# EasyEDA schematic schematic.json
TITLE: Sheet_1; REV: 1.0; Date: 2026-11-13; Sheet: 1/1; Company: Your Company
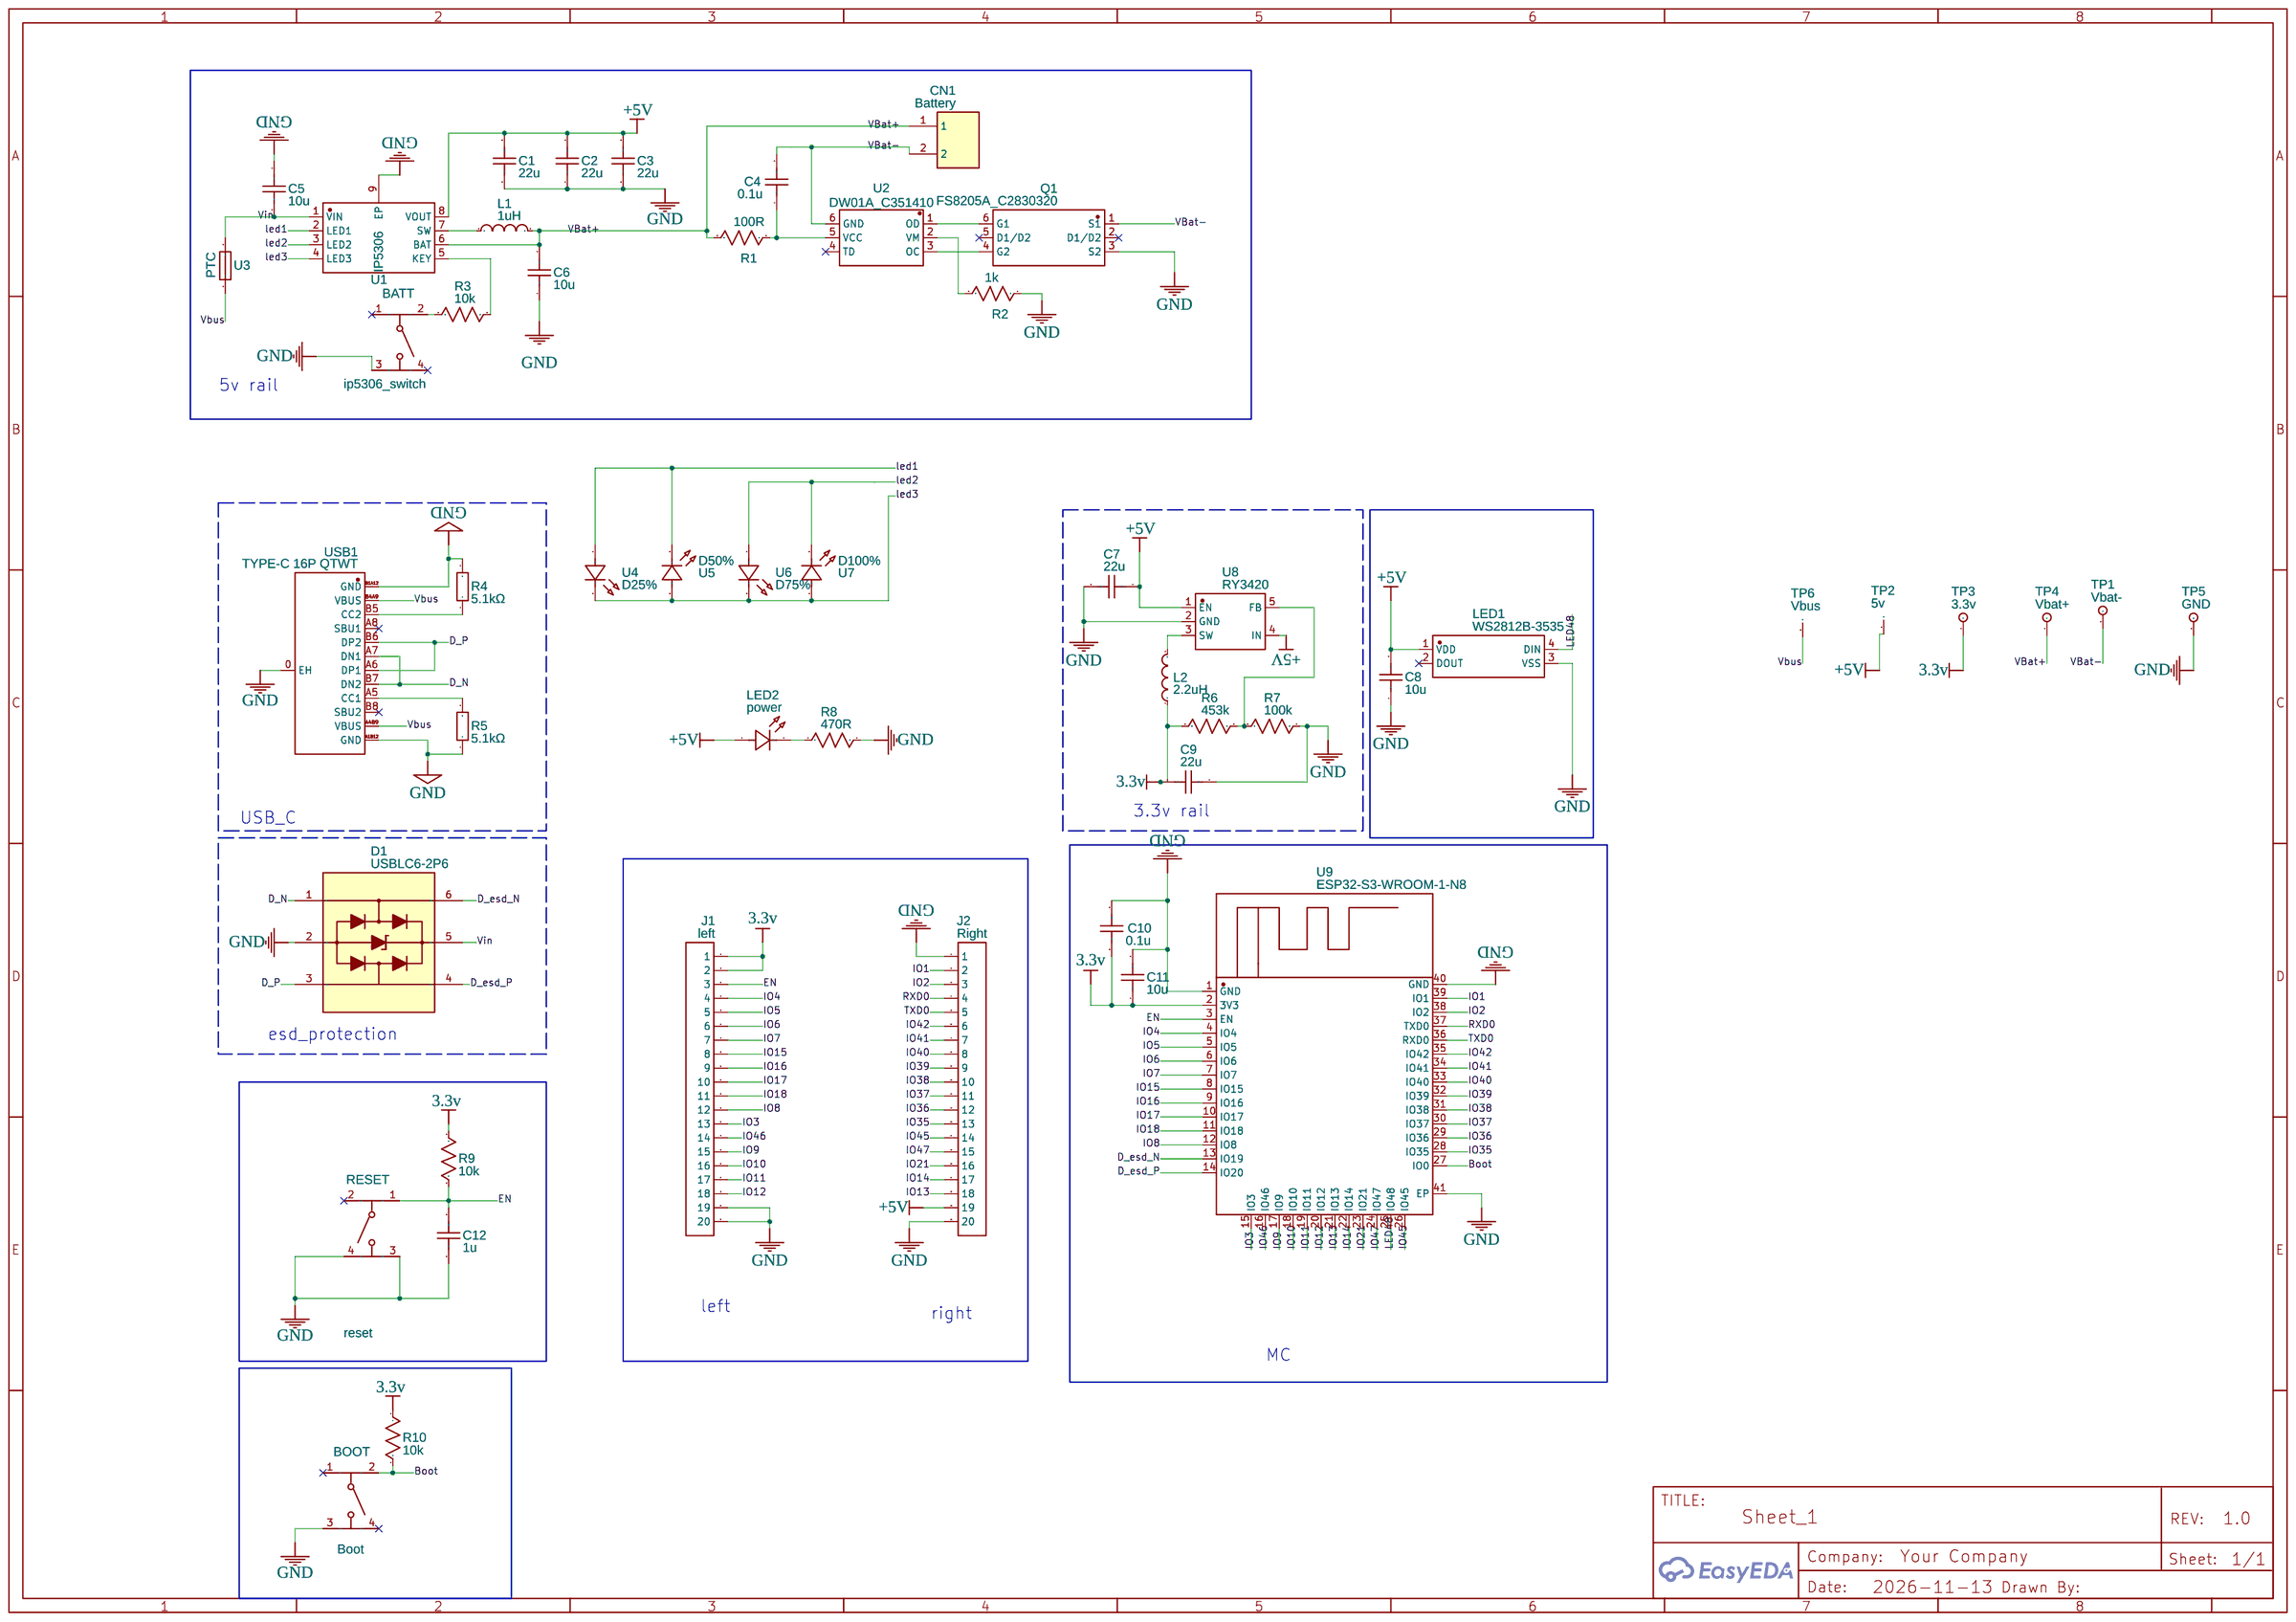
[diagram p0: schematic sheet]

## Parts
BATT  ip5306_switch  [SW-SMD_4P-L4.2-W3.4-P2.15-LS5.2]
BOOT  Boot  [SW-SMD_4P-L4.2-W3.4-P2.15-LS5.2]
C1  22u  [C0805]
C2  22u  [C0805]
C3  22u  [C0805]
C4  0.1u  [C0603]
C5  10u  [C0603]
C6  10u  [C0603]
C7  22u  [C0805]
C8  10u  [C0603]
C9  22u  [C0805]
C10  0.1u  [C0603]
C11  10u  [C0603]
C12  1u  [C0603]
CN1  Battery  [CONN-TH_B2B-PH-K-S]
D1  USBLC6-2P6  [SOT-666-6_L1.6-W1.2-P0.50-LS1.6-BR]
J1  left  [HDR-M-2.54_1X20]
J2  Right  [HDR-M-2.54_1X20]
L1  1uH  [IND-SMD_L4.0-W4.0]
L2  2.2uH  [IND-SMD_L4.0-W4.0_LQH44PN2R2MP0L]
LED1  WS2812B-3535  [LED-SMD_4P-L3.5-W3.5-TL_WS2812B]
LED2  power  [LED0603-FD]
Q1  FS8205A_C2830320  [SOT-23-6_L2.9-W1.6-P0.95-LS2.8-BR]
R1  100R  [R0603]
R2  1k  [R0603]
R3  10k  [R0603]
R4  5.1kΩ  [R0603]
R5  5.1kΩ  [R0603]
R6  453k  [R0603]
R7  100k  [R0603]
R8  470R  [R0603]
R9  10k  [R0603]
R10  10k  [R0603]
RESET  reset  [SW-SMD_4P-L4.2-W3.4-P2.15-LS5.2]
TP1  Vbat-  [TEST_POINT_W1]
TP2  5v  [TEST_POINT_W1]
TP3  3.3v  [TEST_POINT_W1]
TP4  Vbat+  [TEST_POINT_W1]
TP5  GND  [TEST_POINT_W1]
TP6  Vbus  [TEST_POINT_W1]
U1  IP5306  [ESOP-8_L4.9-W3.9-P1.27-LS6.0-BL-EP]
U2  DW01A_C351410  [SOT-23-6_L2.9-W1.6-P0.95-LS2.8-BL]
U3  PTC  [R1812]
U4  D25%  [LED0603-FD]
U5  D50%  [LED0603-FD]
U6  D75%  [LED0603-FD]
U7  D100%  [LED0603-FD]
U8  RY3420  [SOT-23-5_L2.9-W1.6-P0.95-LS2.8-BL]
U9  ESP32-S3-WROOM-1-N8  [WIFIM-SMD_ESP32-S3-WROOM-1-N8]
USB1  TYPE-C 16P QTWT  [USB-TYPE-C-SMD_TYPE-C-16P-QTWT]

## Library data of the parts
BATT BOOT RESET = 4.5x4.5x7.1 SMD Tactile Switch: Supplier: LCSC; Manufacturer: ReliaPro; Supplier Part: C28777; JLCPCB Part Class: Extended Part
C1-C12 = C_0603_US: Contributor: LCEDA_Lib
CN1 = B2B-PH-K-S(LF)(SN): Contributor: LCSC; Supplier: LCSC; Manufacturer: JST; Supplier Part: C131337; JLCPCB Part Class: Extended Part
D1 = USBLC6-2P6: Supplier: LCSC; Manufacturer: ST(意法半导体); Supplier Part: C15999; JLCPCB Part Class: Extended Part
J1 J2 = HDR-M-2.54_1x20: Supplier Part: C50981; Supplier: LCSC; Contributor: LCEDA_Lib
L1 = CMLW4030S1R0NST: Contributor: LCSC; Supplier: LCSC; Supplier Part: C431271; Manufacturer: Cybermax(思博科技); JLCPCB Part Class: Extended Part
L2 = SMNR4020-2.2UH: Supplier: LCSC; Manufacturer: SXN(顺翔诺); Supplier Part: C135262; JLCPCB Part Class: Extended Part
LED1 = WS2812B-3535: Contributor: LCSC; Supplier: LCSC; Manufacturer: worldsemi; Manufacturer Part: WS2812B-Mini; Supplier Part: C114583; JLCPCB Part Class: Extended Part
LED2 = YLED0603B: Supplier: LCSC; Supplier Part: C19171394; Manufacturer: YONGYUTAI(永裕泰); Contributor: lcsc; JLCPCB Part Class: Extended Part
Q1 = FS8205A_C2830320: Contributor: LCSC; Supplier: LCSC; Supplier Part: C2830320; Manufacturer: TECH PUBLIC(台舟); Manufacturer Part: FS8205A; JLCPCB Part Class: Extended Part
R1-R3 R6-R10 = R_0603_US: Contributor: LCEDA_Lib
R4 R5 = RC0603FR-075K1L: Supplier: LCSC; Manufacturer: YAGEO(国巨); Supplier Part: C105580; JLCPCB Part Class: Extended Part
TP1-TP6 = TESTPOINT: Symbol: Connector_TestPoint; Device: Connector_TestPoint; Users: REF**; field4: nf; field5: nf; field6: nf; field7: nf; Add into BOM: yes; Convert to PCB: yes; Origin Footprint: TestPoint:TestPoint_Pad_2.0x2.0mm; Field4: nf; Field5: nf; Field6: nf; Field7: nf; Contributor: leopard.masyk
U1 = IP5306: Contributor: LCSC; Supplier: LCSC; Supplier Part: C181692; Manufacturer: INJOINIC(英集芯); JLCPCB Part Class: Extended Part
U2 = DW01A_C351410: Contributor: LCSC; Supplier: LCSC; Supplier Part: C351410; Manufacturer: PUOLOP(迪浦); Manufacturer Part: DW01A; JLCPCB Part Class: Extended Part
U3 = SMD1812B150TF/24: Contributor: LCSC; Supplier: LCSC; Supplier Part: C269140; Manufacturer: Brightking(君耀电子); JLCPCB Part Class: Extended Part
U4-U7 = YLED0603G: Supplier: LCSC; Supplier Part: C19273151; Manufacturer: YONGYUTAI(永裕泰); JLCPCB Part Class: Extended Part; Contributor: lcsc
U8 = RY3420: Contributor: LCSC; Supplier: LCSC; Supplier Part: C370754; Manufacturer: RYCHiP(蕊源); JLCPCB Part Class: Extended Part
U9 = ESP32-S3-WROOM-1-N8: Contributor: lcsc; Supplier: LCSC; Supplier Part: C2913198; Manufacturer: ESPRESSIF(乐鑫); JLCPCB Part Class: Extended Part
USB1 = TYPE-C 16P QTWT: Contributor: lcsc; Supplier: LCSC; Supplier Part: C5187472; Manufacturer: SHOU HAN(首韩); JLCPCB Part Class: Extended Part

## Nets
3.3v: C9.2 C10.1 C11.1 J1.1 J1.2 L2.1 R6.2 R9.1 R10.1 TP3.1 U9.2(3V3)
+5V: C1.2 C2.2 C3.2 C7.1 C8.2 J2.19 LED1.1(VDD) LED2.1(A) TP2.1 U1.8(VOUT) U8.1(EN) U8.4(IN)
GND: BATT.3 BOOT.3 C1.1 C2.1 C3.1 C5.1 C6.1 C7.2 C8.1 C9.1 C10.2 C11.2 C12.1 D1.2(GND) J1.19 J1.20 J2.1 J2.20 LED1.3(VSS) Q1.3(S2) R2.1 R4.2 R5.1 R7.1 R8.2 RESET.3 RESET.4 TP5.1 U1.9(EP) U8.2(GND) U9.1(GND) U9.40(GND) U9.41(EP) USB1.0(EH) USB1.A1B12(GND) USB1.B1A12(GND)
VBat+: C6.2 CN1.1 L1.2 R1.2 TP4.1 U1.6(BAT)
VBat-: C4.2 CN1.2 Q1.1(S1) TP1.1 U2.6(GND)
Vbus: TP6.1 U3.1 USB1.A4B9(VBUS) USB1.B4A9(VBUS)
Vin: C5.2 D1.5(VBUS) U1.1(VIN) U3.2
Boot: BOOT.2 R10.2 U9.27(IO0)
D_esd_N: D1.6(I/O1) U9.13(IO19)
D_esd_P: D1.4(I/O2) U9.14(IO20)
D_N: D1.1(I/O1) USB1.A7(DN1) USB1.B7(DN2)
D_P: D1.3(I/O2) USB1.A6(DP1) USB1.B6(DP2)
EN: C12.2 J1.3 R9.2 RESET.1 U9.3(EN)
IO1: J2.2 U9.39(IO1)
IO2: J2.3 U9.38(IO2)
IO3: J1.13 U9.15(IO3)
IO4: J1.4 U9.4(IO4)
IO5: J1.5 U9.5(IO5)
IO6: J1.6 U9.6(IO6)
IO7: J1.7 U9.7(IO7)
IO8: J1.12 U9.12(IO8)
IO9: J1.15 U9.17(IO9)
IO10: J1.16 U9.18(IO10)
IO11: J1.17 U9.19(IO11)
IO12: J1.18 U9.20(IO12)
IO13: J2.18 U9.21(IO13)
IO14: J2.17 U9.22(IO14)
IO15: J1.8 U9.8(IO15)
IO16: J1.9 U9.9(IO16)
IO17: J1.10 U9.10(IO17)
IO18: J1.11 U9.11(IO18)
IO21: J2.16 U9.23(IO21)
IO35: J2.13 U9.28(IO35)
IO36: J2.12 U9.29(IO36)
IO37: J2.11 U9.30(IO37)
IO38: J2.10 U9.31(IO38)
IO39: J2.9 U9.32(IO39)
IO40: J2.8 U9.33(IO40)
IO41: J2.7 U9.34(IO41)
IO42: J2.6 U9.35(IO42)
IO45: J2.14 U9.26(IO45)
IO46: J1.14 U9.16(IO46)
IO47: J2.15 U9.24(IO47)
led1: U1.2(LED1) U4.1(+) U5.2(-)
led2: U1.3(LED2) U6.1(+) U7.2(-)
led3: U1.4(LED3) U4.2(-) U5.1(+) U6.2(-) U7.1(+)
LED48: LED1.4(DIN) U9.25(IO48)
RXD0: J2.4 U9.37(TXD0)
TXD0: J2.5 U9.36(RXD0)
Net-(BATT-2): BATT.2 R3.2
Net-(C4-1): C4.1 R1.1 U2.5(VCC)
Net-(L1-1): L1.1 U1.7(SW)
Net-(L2-2): L2.2 U8.3(SW)
Net-(LED2-2): LED2.2(K) R8.1
Net-(Q1-4): Q1.4(G2) U2.3(OC)
Net-(Q1-6): Q1.6(G1) U2.1(OD)
Net-(R2-2): R2.2 U2.2(VM)
Net-(R3-1): R3.1 U1.5(KEY)
Net-(R4-1): R4.1 USB1.B5(CC2)
Net-(R5-2): R5.2 USB1.A5(CC1)
Net-(R6-1): R6.1 R7.2 U8.5(FB)

Not connected (* = marked no-connect by the designer): BATT 1* 4*; BOOT 1* 4*; LED1 2(DOUT)*; Q1 2(D1/D2)* 5(D1/D2)*; RESET 2*; U2 4(TD)*; USB1 A8(SBU1)* B8(SBU2)*

## Notes on the sheet
- 5v rail
- 3.3v rail
- USB_C
- esd_protection
- left
- right
- MC
